# Altium schematic sheet OpenApolloV2_Altium_export_non-native.schdoc
size 843 x 614 mm
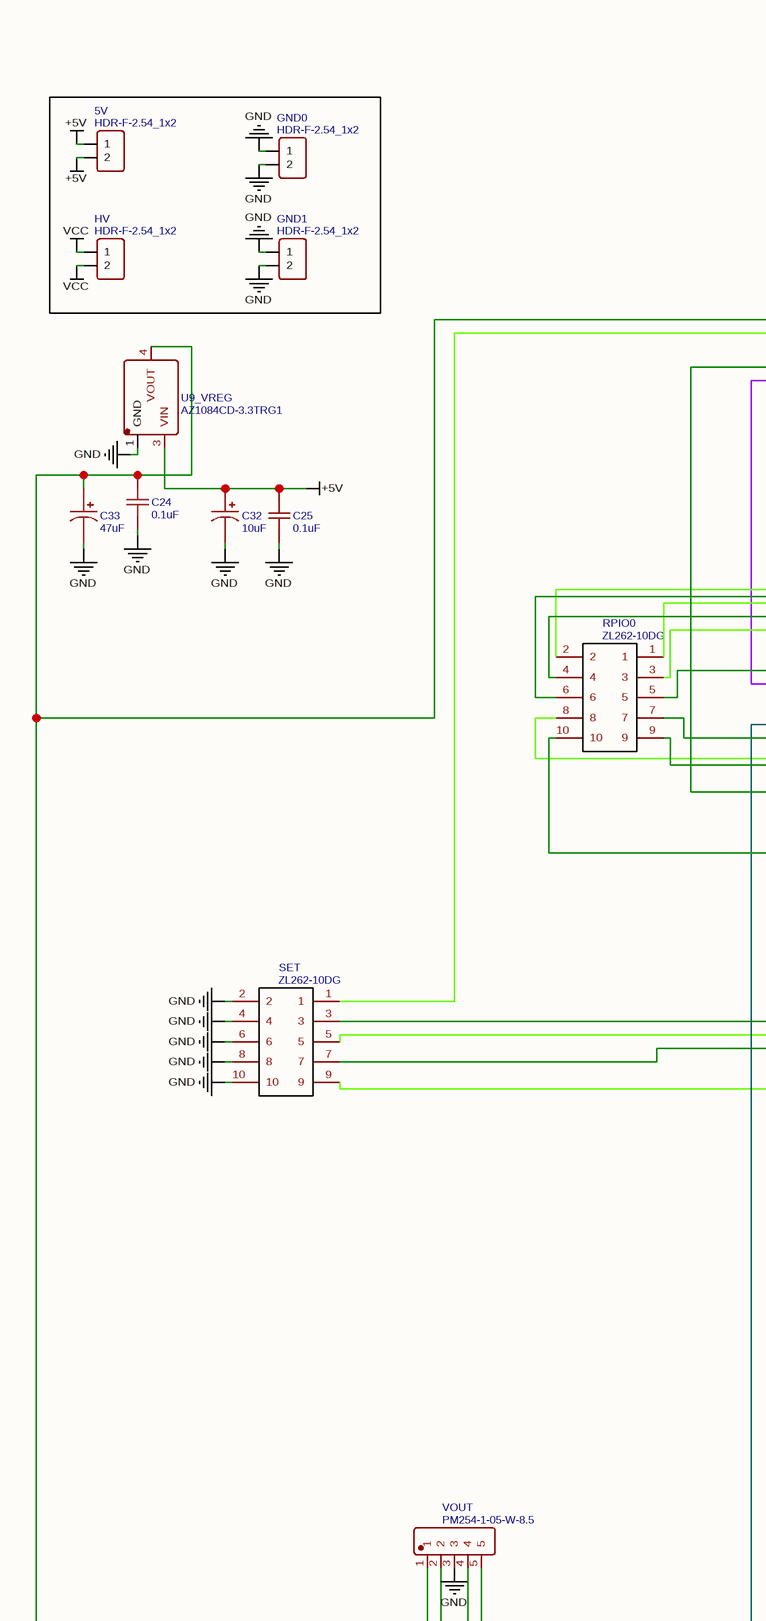
[diagram p0: OpenApolloV2_Altium_export_non-native.schdoc, top left]
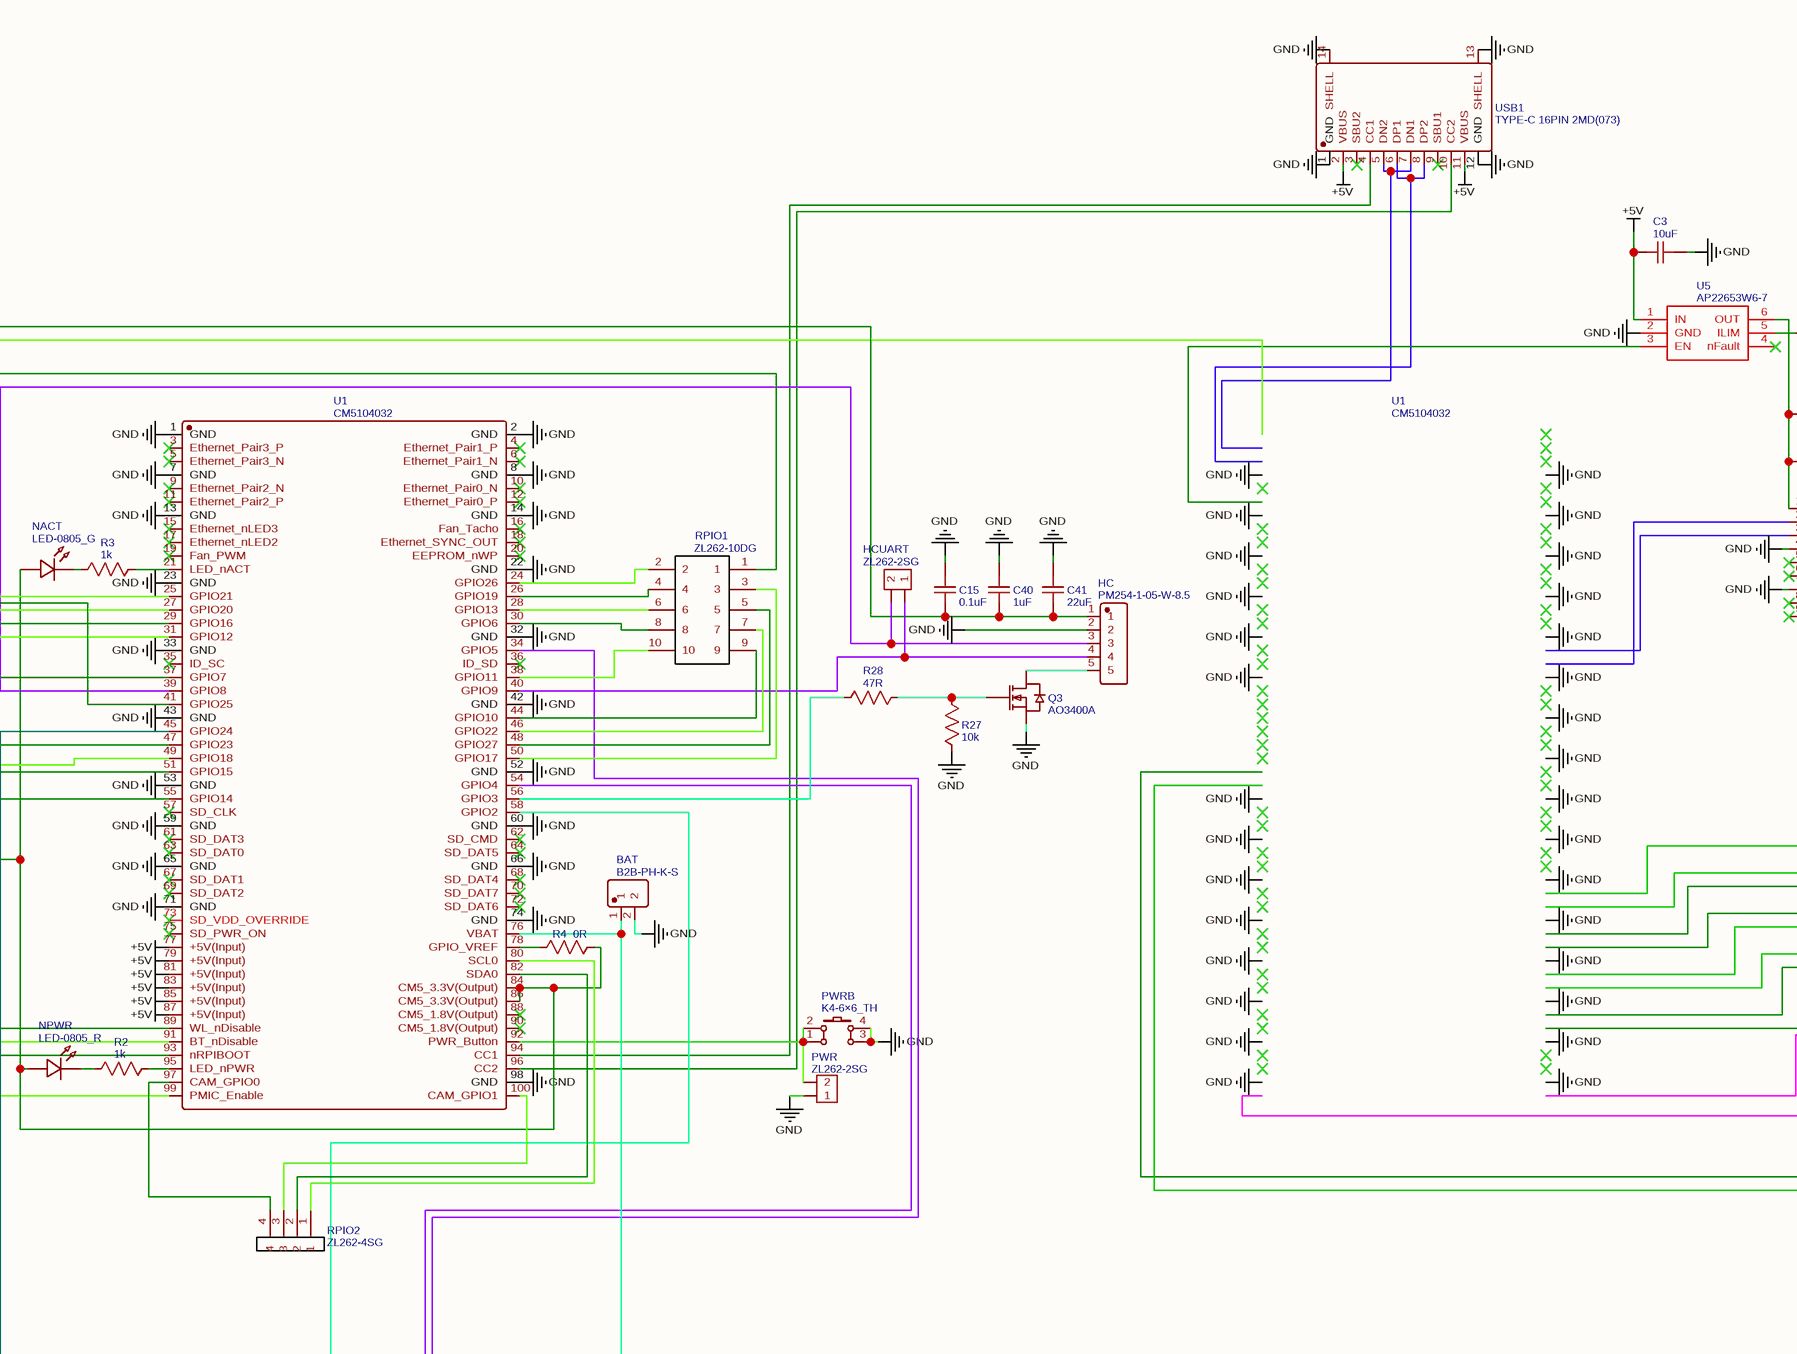
[diagram p1: OpenApolloV2_Altium_export_non-native.schdoc, top middle]
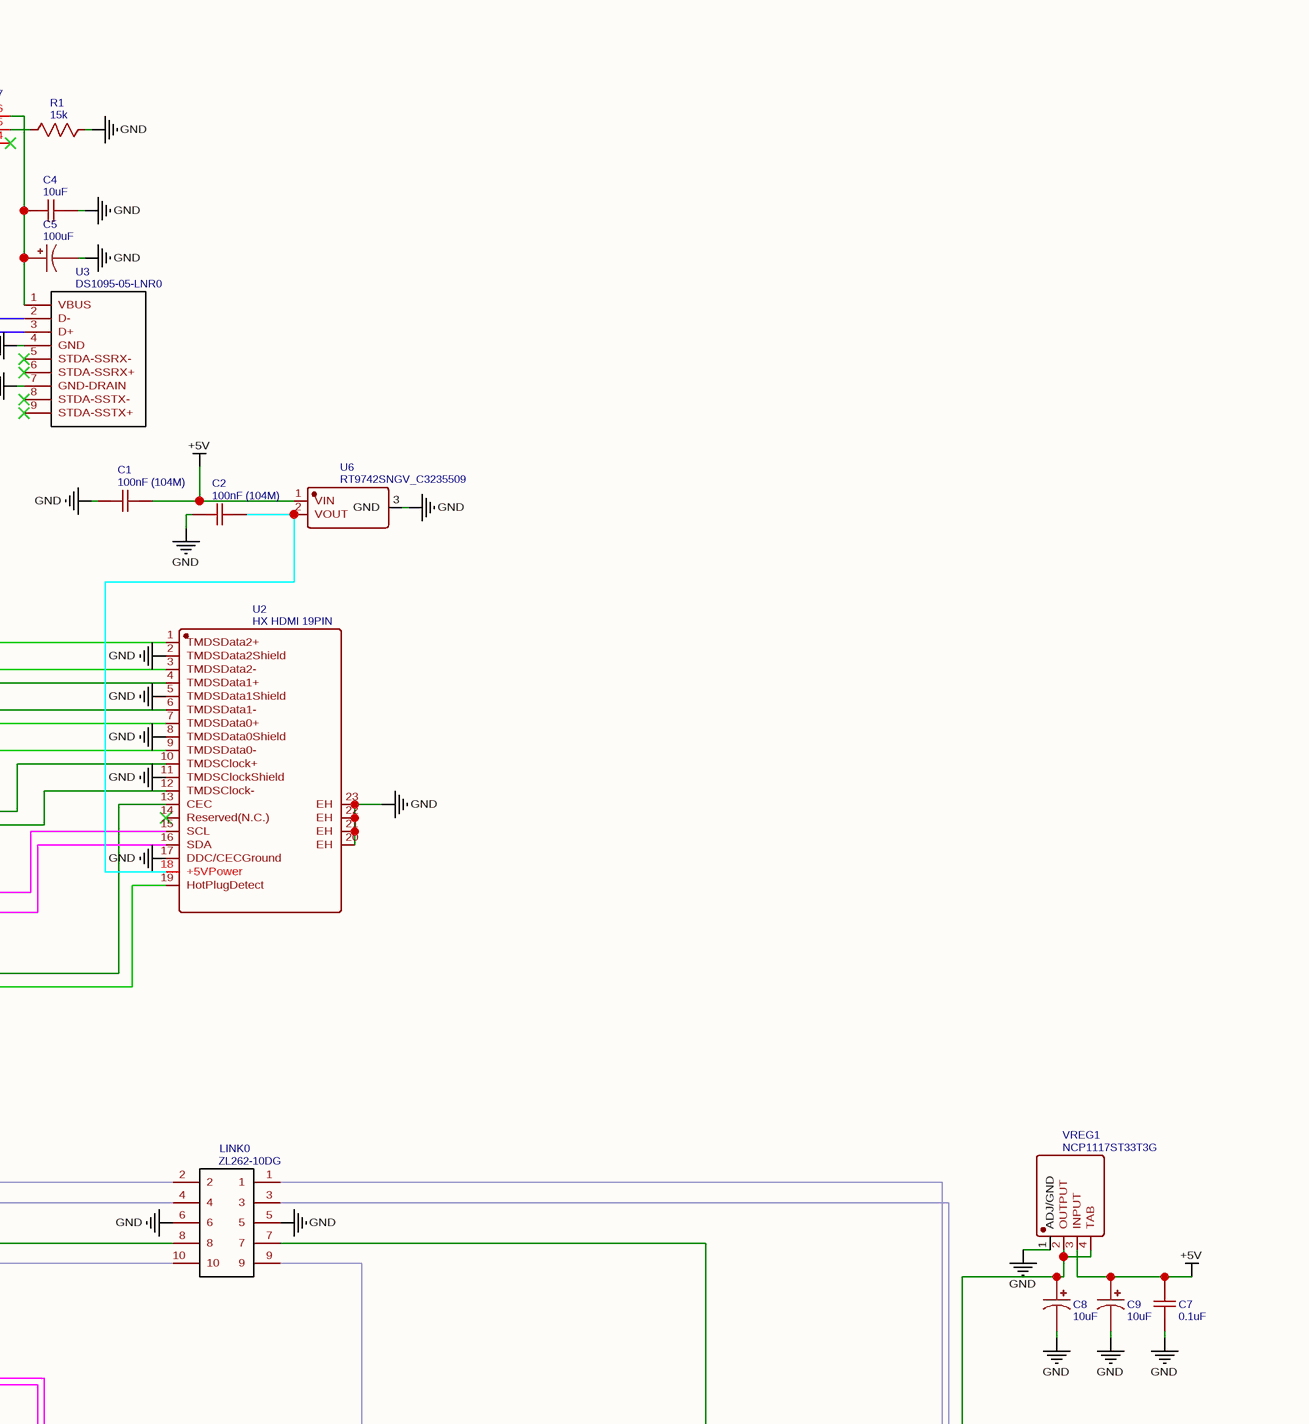
[diagram p2: OpenApolloV2_Altium_export_non-native.schdoc, top right]
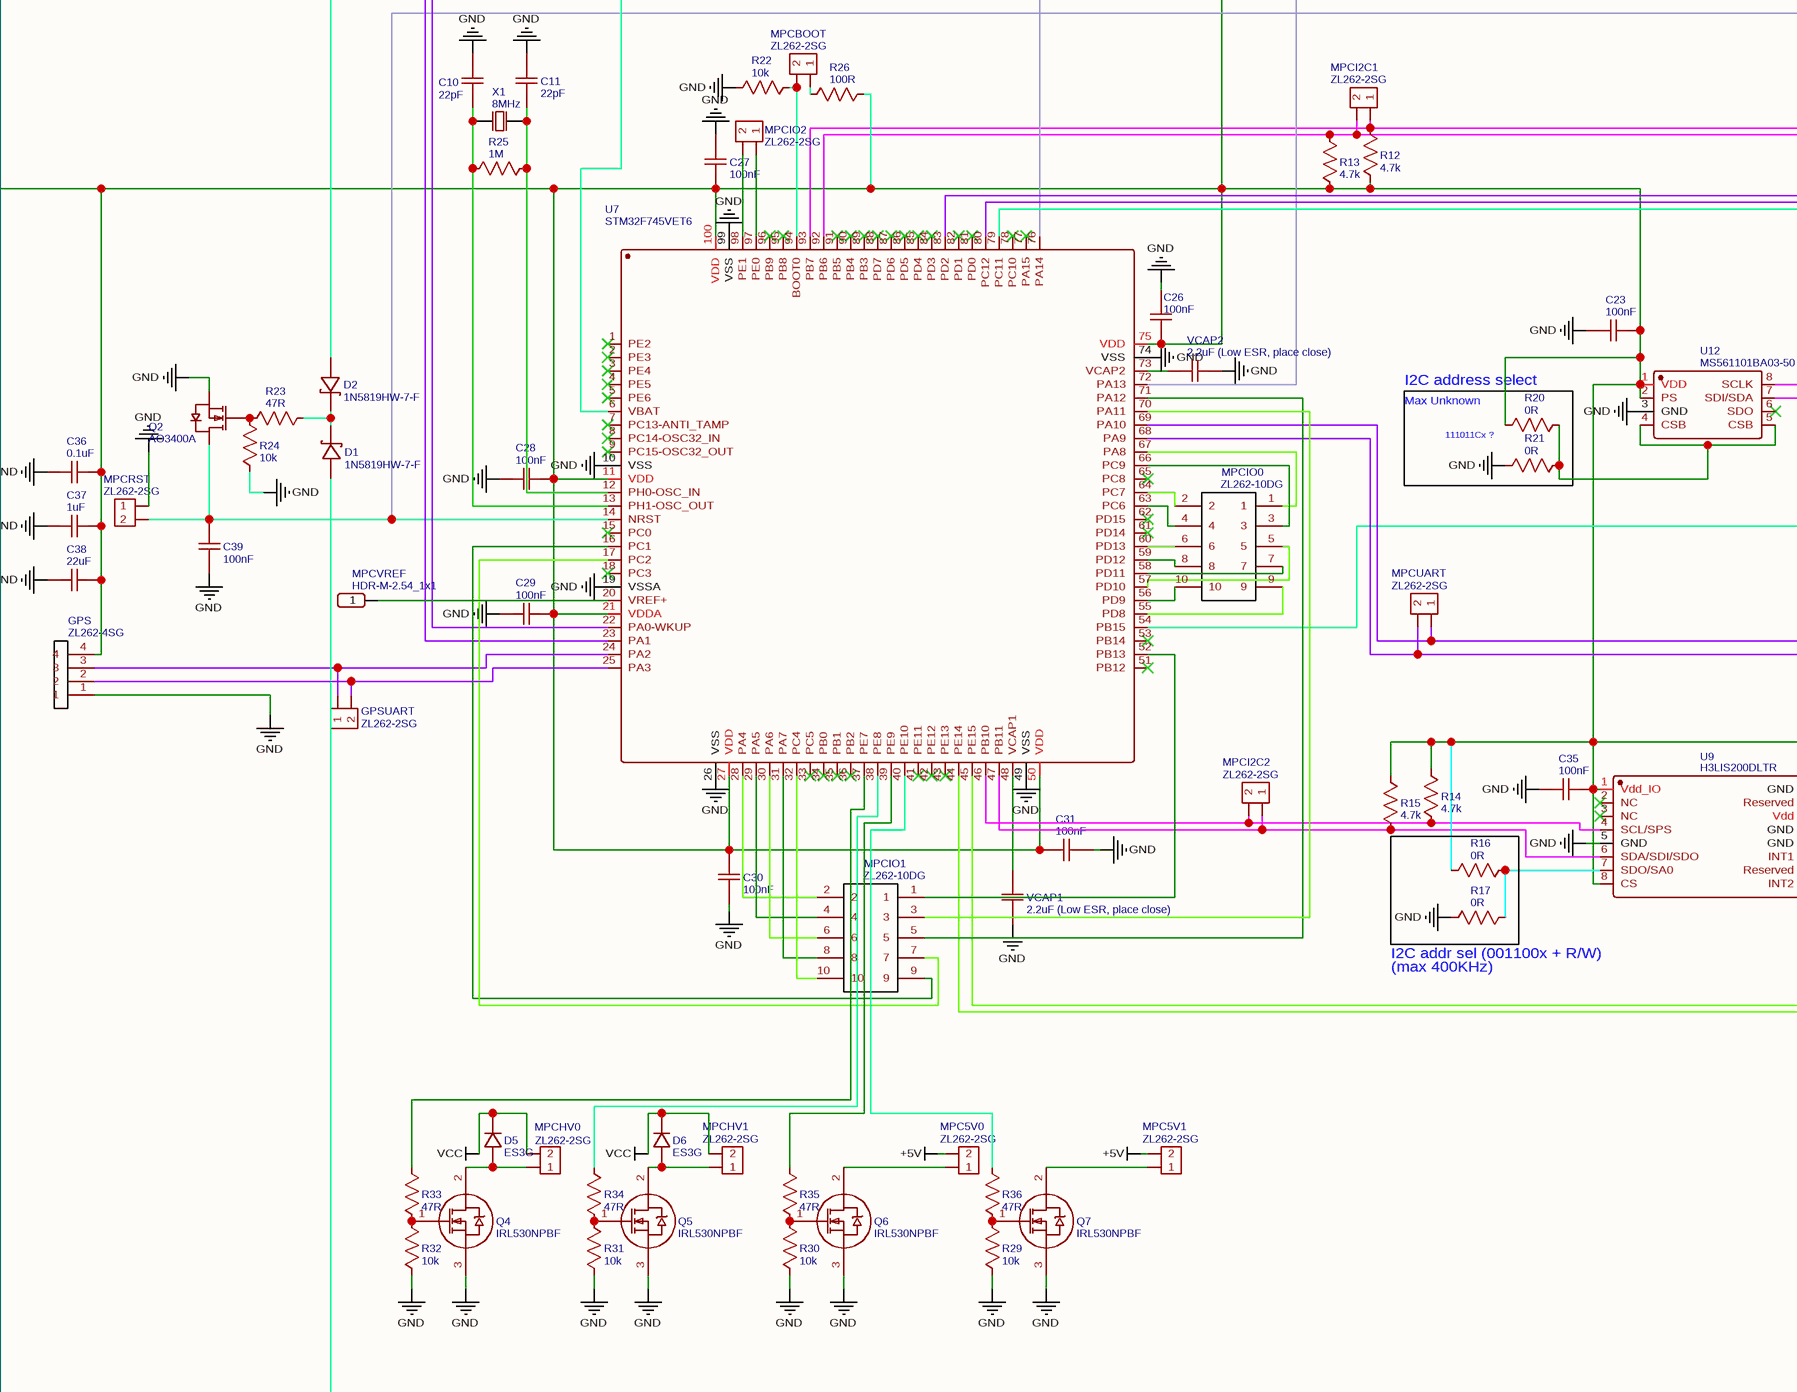
[diagram p3: OpenApolloV2_Altium_export_non-native.schdoc, bottom middle]
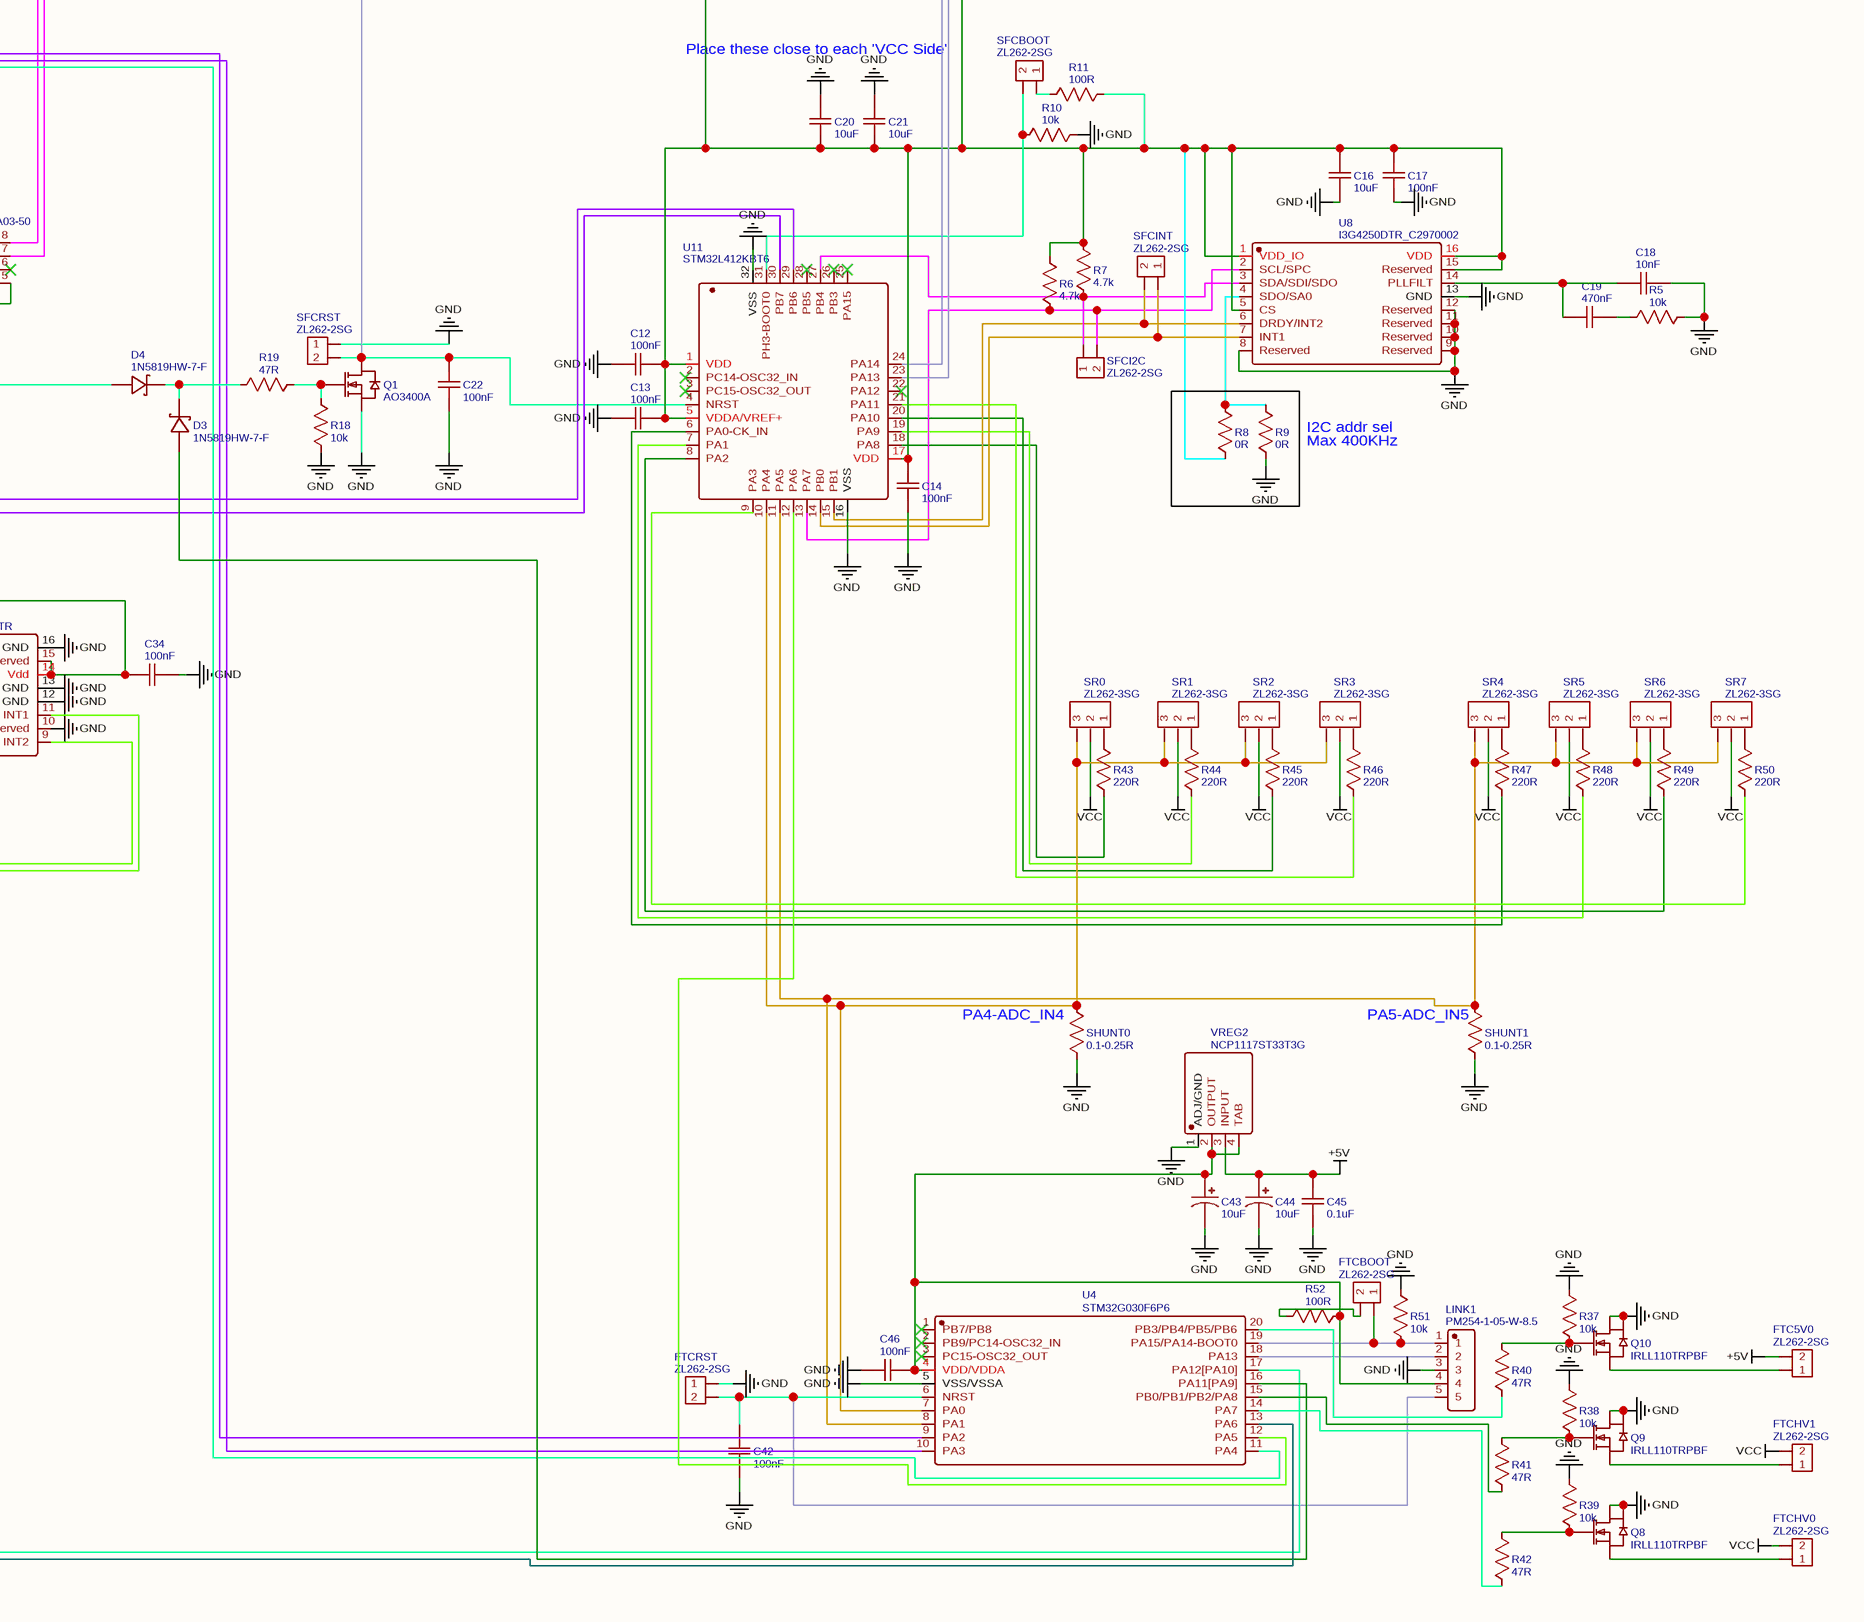
[diagram p4: OpenApolloV2_Altium_export_non-native.schdoc, bottom right]

## Parts
(Parts that share a designator on the sheet are numbered #1, #2 ... from top to bottom, then left to right.)
5V  HDR-F-2.54_1x2  [HDR-F-2.54_1X2]
BAT  B2B-PH-K-S  [CONN-TH_B2B-PH-K-S]
C1  100nF (104M)  [C0805]
C2  100nF (104M)  [C0805]
C3  10uF  [C0805]
C4  10uF  [C0805]
C5  100uF  [CAP-D5.0×F2.0]
C7  0.1uF  [C0805]
C8  10uF  [CAP-D5.0×F2.0]
C9  10uF  [CAP-D5.0×F2.0]
C10  22pF  [RAD-0.1]
C11  22pF  [RAD-0.1]
C12  100nF  [C0805]
C13  100nF  [C0805]
C14  100nF  [C0805]
C15  0.1uF  [C0805]
C16  10uF  [C0805]
C17  100nF  [C0805]
C18  10nF  [C0805]
C19  470nF  [C0805]
C20  10uF  [C0805]
C21  10uF  [C0805]
C22  100nF  [C0805]
C23  100nF  [C1206]
C24  0.1uF  [C0805]
C25  0.1uF  [C0805]
C26  100nF  [C0805]
C27  100nF  [C0805]
C28  100nF  [C0805]
C29  100nF  [C0805]
C30  100nF  [C0805]
C31  100nF  [C0805]
C32  10uF  [CAP-D5.0×F2.0]
C33  47uF  [CAP-D4.0×F1.5]
C34  100nF  [C0805]
C35  100nF  [C0805]
C36  0.1uF  [C0805]
C37  1uF  [C0805]
C38  22uF  [C0805]
C39  100nF  [C0805]
C40  1uF  [C0805]
C41  22uF  [C0805]
C42  100nF  [C0805]
C43  10uF  [CAP-D5.0×F2.0]
C44  10uF  [CAP-D5.0×F2.0]
C45  0.1uF  [C0805]
C46  100nF  [C0805]
D1  1N5819HW-7-F  [SOD-123_L2.7-W1.6-LS3.7-RD]
D2  1N5819HW-7-F  [SOD-123_L2.7-W1.6-LS3.7-RD]
D3  1N5819HW-7-F  [SOD-123_L2.7-W1.6-LS3.7-RD]
D4  1N5819HW-7-F  [SOD-123_L2.7-W1.6-LS3.7-RD]
D5  ES3G  [SMC_L7.1-W6.2-LS8.1-RD]
D6  ES3G  [SMC_L7.1-W6.2-LS8.1-RD]
FTC5V0  ZL262-2SG  [HEADER 1X2 FEMALE AG4]
FTCBOOT  ZL262-2SG  [HEADER 1X2 FEMALE AG4]
FTCHV0  ZL262-2SG  [HEADER 1X2 FEMALE AG4]
FTCHV1  ZL262-2SG  [HEADER 1X2 FEMALE AG4]
FTCRST  ZL262-2SG  [HEADER 1X2 FEMALE AG4]
GND0  HDR-F-2.54_1x2  [HDR-F-2.54_1X2]
GND1  HDR-F-2.54_1x2  [HDR-F-2.54_1X2]
GPS  ZL262-4SG  [TUSKESOR_ALJZET_4_LABU_ZL262-4SG]
GPSUART  ZL262-2SG  [HEADER 1X2 FEMALE AG4]
HC  PM254-1-05-W-8.5  [HDR-TH_5P-P2.54-H-F-W10.0-N]
HCUART  ZL262-2SG  [HEADER 1X2 FEMALE AG4]
HV  HDR-F-2.54_1x2  [HDR-F-2.54_1X2]
LINK0  ZL262-10DG  [ZL262-10DG]
LINK1  PM254-1-05-W-8.5  [HDR-TH_5P-P2.54-H-F-W10.0-N]
MPC5V0  ZL262-2SG  [HEADER 1X2 FEMALE AG4]
MPC5V1  ZL262-2SG  [HEADER 1X2 FEMALE AG4]
MPCBOOT  ZL262-2SG  [HEADER 1X2 FEMALE AG4]
MPCHV0  ZL262-2SG  [HEADER 1X2 FEMALE AG4]
MPCHV1  ZL262-2SG  [HEADER 1X2 FEMALE AG4]
MPCI2C1  ZL262-2SG  [HEADER 1X2 FEMALE AG4]
MPCI2C2  ZL262-2SG  [HEADER 1X2 FEMALE AG4]
MPCIO0  ZL262-10DG  [ZL262-10DG]
MPCIO1  ZL262-10DG  [ZL262-10DG]
MPCIO2  ZL262-2SG  [HEADER 1X2 FEMALE AG4]
MPCRST  ZL262-2SG  [HEADER 1X2 FEMALE AG4]
MPCUART  ZL262-2SG  [HEADER 1X2 FEMALE AG4]
MPCVREF  HDR-M-2.54_1x1  [HDR-M-2.54_1X1]
NACT  LED-0805_G  [LED0805_GREEN]
NPWR  LED-0805_R  [LED0805_RED]
PWR  ZL262-2SG  [HEADER 1X2 FEMALE AG4]
PWRB  K4-6×6_TH  [KEY-TH_4P-L6.0-W6.0-P4.50-LS6.5]
Q1  AO3400A  [SOT-23-3_L2.9-W1.3-P1.90-LS2.4-BR]
Q2  AO3400A  [SOT-23-3_L2.9-W1.3-P1.90-LS2.4-BR]
Q3  AO3400A  [SOT-23-3_L2.9-W1.3-P1.90-LS2.4-BR]
Q4  IRL530NPBF  [TO-220-3_L10.0-W4.5-P2.54-L]
Q5  IRL530NPBF  [TO-220-3_L10.0-W4.5-P2.54-L]
Q6  IRL530NPBF  [TO-220-3_L10.0-W4.5-P2.54-L]
Q7  IRL530NPBF  [TO-220-3_L10.0-W4.5-P2.54-L]
Q8  IRLL110TRPBF  [SOT-223_L6.5-W3.5-P2.30-LS7.0-BR]
Q9  IRLL110TRPBF  [SOT-223_L6.5-W3.5-P2.30-LS7.0-BR]
Q10  IRLL110TRPBF  [SOT-223_L6.5-W3.5-P2.30-LS7.0-BR]
R1  15k  [R0805]
R2  1k  [R0805]
R3  1k  [R0805]
R4  0R  [R0805]
R5  10k  [R0805]
R6  4.7k  [R0805]
R7  4.7k  [R0805]
R8  0R  [R0805]
R9  0R  [R0805]
R10  10k  [R0805]
R11  100R  [R0805]
R12  4.7k  [R0805]
R13  4.7k  [R0805]
R14  4.7k  [R0805]
R15  4.7k  [R0805]
R16  0R  [R0805]
R17  0R  [R0805]
R18  10k  [R0805]
R19  47R  [R0805]
R20  0R  [R0805]
R21  0R  [R0805]
R22  10k  [R0805]
R23  47R  [R0805]
R24  10k  [R0805]
R25  1M  [R0805]
R26  100R  [R0805]
R27  10k  [R0805]
R28  47R  [R0805]
R29  10k  [R0805]
R30  10k  [R0805]
R31  10k  [R0805]
R32  10k  [R0805]
R33  47R  [R0805]
R34  47R  [R0805]
R35  47R  [R0805]
R36  47R  [R0805]
R37  10k  [R0805]
R38  10k  [R0805]
R39  10k  [R0805]
R40  47R  [R0805]
R41  47R  [R0805]
R42  47R  [R0805]
R43  220R  [R0805]
R44  220R  [R0805]
R45  220R  [R0805]
R46  220R  [R0805]
R47  220R  [R0805]
R48  220R  [R0805]
R49  220R  [R0805]
R50  220R  [R0805]
R51  10k  [R0805]
R52  100R  [R0805]
RPIO0  ZL262-10DG  [ZL262-10DG]
RPIO1  ZL262-10DG  [ZL262-10DG]
RPIO2  ZL262-4SG  [TUSKESOR_ALJZET_4_LABU_ZL262-4SG]
SET  ZL262-10DG  [ZL262-10DG]
SFCBOOT  ZL262-2SG  [HEADER 1X2 FEMALE AG4]
SFCI2C  ZL262-2SG  [HEADER 1X2 FEMALE AG4]
SFCINT  ZL262-2SG  [HEADER 1X2 FEMALE AG4]
SFCRST  ZL262-2SG  [HEADER 1X2 FEMALE AG4]
SHUNT0  0.1-0.25R  [R_AXIAL-1.0]
SHUNT1  0.1-0.25R  [R_AXIAL-1.0]
SR0  ZL262-3SG  [HDR-F-2.54_1X3]
SR1  ZL262-3SG  [HDR-F-2.54_1X3]
SR2  ZL262-3SG  [HDR-F-2.54_1X3]
SR3  ZL262-3SG  [HDR-F-2.54_1X3]
SR4  ZL262-3SG  [HDR-F-2.54_1X3]
SR5  ZL262-3SG  [HDR-F-2.54_1X3]
SR6  ZL262-3SG  [HDR-F-2.54_1X3]
SR7  ZL262-3SG  [HDR-F-2.54_1X3]
U1#1  CM5104032  [COMM-SMD_L55.0-W40.0_CM5]
U1#2  CM5104032  [COMM-SMD_L55.0-W40.0_CM5]
U2  HX HDMI 19PIN  [HDMI-SMD_HX-HDMI-19PIN]
U3  DS1095-05-LNR0  [DS1095-05-LNR0]
U4  STM32G030F6P6  [TSSOP-20_L6.5-W4.4-P0.65-LS6.4-BL]
U5  AP22653W6-7  [AP22653W6-7]
U6  RT9742SNGV_C3235509  [SOT-23-3_L2.9-W1.6-P1.90-LS2.8-BR]
U7  STM32F745VET6  [LQFP-100_L14.0-W14.0-P0.50-LS16.0-BL]
U8  I3G4250DTR_C2970002  [LGA-16_L4.0-W4.0-P0.65-TL]
U9  H3LIS200DLTR  [LGA-16_L3.0-W3.0-P0.50-BL]
U9_VREG  AZ1084CD-3.3TRG1  [TO-252-2_L6.5-W6.1-P4.58-LS10.0-TL]
U11  STM32L412KBT6  [LQFP-32_L7.0-W7.0-P0.80-LS9.0-BL]
U12  MS561101BA03-50  [SENSORS-SMD_MS5611-01BA03]
USB1  TYPE-C 16PIN 2MD(073)  [USB-C-SMD_TYPE-C-6PIN-2MD-073]
VCAP1  2.2uF (Low ESR, place close)  [C0805]
VCAP2  2.2uF (Low ESR, place close)  [C0805]
VOUT  PM254-1-05-W-8.5  [HDR-TH_5P-P2.54-H-F-W10.0-N]
VREG1  NCP1117ST33T3G  [SOT-223-3_L6.5-W3.4-P2.30-LS7.0-BR]
VREG2  NCP1117ST33T3G  [SOT-223-3_L6.5-W3.4-P2.30-LS7.0-BR]
X1  8MHz  [HC-49S_L11.5-W4.7-P4.88]

## Blocks framed on the sheet
I2C address select: R20 R21

## Nets
+5V: 5V.1 5V.2 C1.2 C3.1 C7.2 C9.1 C25.2 C32.1 C44.1 C45.2 FTC5V0.2 MPC5V0.2 MPC5V1.2 U1#1.77(+5V(Input)) U1#1.79(+5V(Input)) U1#1.81(+5V(Input)) U1#1.83(+5V(Input)) U1#1.85(+5V(Input)) U1#1.87(+5V(Input)) U5.1(IN) U6.1(VIN) U9_VREG.3(VIN) USB1.2(VBUS) USB1.11(VBUS) VREG1.3(INPUT) VREG2.3(INPUT)
GND: BAT.2 C1.1 C2.1 C3.2 C4.2 C5.2 C7.1 C8.2 C9.2 C10.1 C11.1 C12.1 C13.1 C14.1 C15.2 C16.1 C17.1 C18.2 C20.2 C21.2 C22.1 C23.1 C24.1 C25.1 C26.1 C27.1 C28.1 C29.1 C30.1 C31.1 C32.2 C33.2 C34.2 C35.1 C36.1 C37.1 C38.1 C39.1 C40.2 C41.2 C42.1 C43.2 C44.2 C45.1 C46.1 FTCRST.1 GND0.1 GND0.2 GND1.1 GND1.2 GPS.1 HC.2 LINK0.5 LINK0.6 LINK1.3 MPCRST.1 PWR.1 PWRB.3 PWRB.4 Q1.2(S) Q2.2(S) Q3.2(S) Q4.3(S) Q5.3(S) Q6.3(S) Q7.3(S) Q8.2(D) Q8.4(D) Q9.2(D) Q9.4(D) Q10.2(D) Q10.4(D) R1.2 R5.2 R9.1 R10.2 R17.1 R18.1 R21.1 R22.1 R24.1 R27.1 R29.1 R30.1 R31.1 R32.1 R37.2 R38.2 R39.2 R51.2 SET.2 SET.4 SET.6 SET.8 SET.10 SFCRST.1 SHUNT0.1 SHUNT1.1 U1#1.1(GND) U1#1.2(GND) U1#1.7(GND) U1#1.8(GND) U1#1.13(GND) U1#1.14(GND) U1#1.22(GND) U1#1.23(GND) U1#1.32(GND) U1#1.33(GND) U1#1.42(GND) U1#1.43(GND) U1#1.52(GND) U1#1.53(GND) U1#1.59(GND) U1#1.60(GND) U1#1.65(GND) U1#1.66(GND) U1#1.71(GND) U1#1.74(GND) U1#1.98(GND) U2.2(TMDSData2Shield) U2.5(TMDSData1Shield) U2.8(TMDSData0Shield) U2.11(TMDSClockShield) U2.17(DDC/CECGround) U2.20(EH) U2.21(EH) U2.22(EH) U2.23(EH) U3.4(GND) U3.7(GND-DRAIN) U4.5(VSS/VSSA) U5.2(GND) U6.3(GND) U7.10(VSS) U7.19(VSSA) U7.26(VSS) U7.49(VSS) U7.74(VSS) U7.99(VSS) U8.8(Reserved) U8.9(Reserved) U8.10(Reserved) U8.11(Reserved) U8.12(Reserved) U8.13(GND) U9.5(GND) U9.10(Reserved) U9.12(GND) U9.13(GND) U9.16(GND) U9_VREG.1(GND) U11.16(VSS) U11.32(VSS) U12.3(GND) USB1.1(GND) USB1.12(GND) USB1.13(SHELL) USB1.14(SHELL) VCAP1.1 VCAP2.2 VOUT.3 VREG1.1(ADJ/GND) VREG2.1(ADJ/GND)
VCC: D5.1 D6.1 FTCHV0.2 FTCHV1.2 HV.1 HV.2 MPCHV0.2 MPCHV1.2 SR0.2 SR1.2 SR2.2 SR3.2 SR4.2 SR5.2 SR6.2 SR7.2
NetBAT_1: BAT.1 U1#1.76(VBAT) U7.6(VBAT)
NetC2_2: C2.2 U2.18(+5VPower) U6.2(VOUT)
NetC4_1: C4.1 C5.1 U3.1(VBUS) U5.6(OUT)
NetC8_1: C8.1 C12.2 C13.2 C14.2 C16.2 C17.2 C20.1 C21.1 LINK0.7 R6.2 R7.2 R8.1 R11.2 U8.1(VDD_IO) U8.5(CS) U8.15(Reserved) U8.16(VDD) U11.1(VDD) U11.5(VDDA/VREF+) U11.17(VDD) VREG1.2(OUTPUT) VREG1.4(TAB)
NetC10_2: C10.2 R25.2 U7.13(PH1-OSC_OUT) X1.2
NetC11_2: C11.2 R25.1 U7.12(PH0-OSC_IN) X1.1
NetC15_1: C15.1 C23.2 C24.2 C26.2 C27.2 C28.2 C29.2 C30.2 C31.2 C33.1 C34.1 C35.2 C36.2 C37.2 C38.2 C40.1 C41.1 GPS.4 HC.1 LINK0.8 R12.1 R13.1 R14.2 R15.2 R16.1 R20.1 R26.1 U7.11(VDD) U7.21(VDDA) U7.27(VDD) U7.50(VDD) U7.75(VDD) U7.100(VDD) U9.1(Vdd_IO) U9.8(CS) U9.14(Vdd) U9.15(Reserved) U9_VREG.4(VOUT) U12.1(VDD) U12.2(PS) VOUT.1 VOUT.2 VOUT.4 VOUT.5
NetC18_1: C18.1 C19.1 U8.14(PLLFILT)
NetC19_2: C19.2 R5.1
NetC22_2: C22.2 LINK0.9 Q1.3(D) SFCRST.2 U11.4(NRST)
NetC39_2: C39.2 LINK0.10 MPCRST.2 Q2.3(D) U7.14(NRST)
NetC42_2: C42.2 FTCRST.2 LINK1.5 U4.6(NRST)
NetC43_1: C43.1 C46.2 LINK1.4 R52.2 U4.4(VDD/VDDA) VREG2.2(OUTPUT) VREG2.4(TAB)
NetD1_1: D1.1(K) D2.1(K) R23.1
NetD1_2: D1.2(A) U4.17(PA12[PA10])
NetD2_2: D2.2(A) U1#1.58(GPIO2)
NetD3_1: D3.1(K) D4.1(K) R19.1
NetD3_2: D3.2(A) U4.16(PA11[PA9])
NetD4_2: D4.2(A) U7.54(PB15)
NetD5_2: D5.2 MPCHV0.1 Q4.2(D)
NetD6_2: D6.2 MPCHV1.1 Q5.2(D)
NetFTC5V0_1: FTC5V0.1 Q10.3(S)
NetFTCBOOT_1: FTCBOOT.1 LINK1.1 R51.1 U4.19(PA15/PA14-BOOT0)
NetFTCBOOT_2: FTCBOOT.2 R52.1
NetFTCHV0_1: FTCHV0.1 Q8.3(S)
NetFTCHV1_1: FTCHV1.1 Q9.3(S)
NetGPS_2: GPS.2 GPSUART.2 U7.25(PA3)
NetGPS_3: GPS.3 GPSUART.1 U7.24(PA2)
NetHC_3: HC.3 HCUART.2 U1#1.39(GPIO8)
NetHC_4: HC.4 HCUART.1 U1#1.40(GPIO9)
NetHC_5: HC.5 Q3.3(D)
NetLINK0_1: LINK0.1 U11.24(PA14)
NetLINK0_2: LINK0.2 U7.76(PA14)
NetLINK0_3: LINK0.3 U11.23(PA13)
NetLINK0_4: LINK0.4 U7.72(PA13)
NetLINK1_2: LINK1.2 U4.18(PA13)
NetMPC5V0_1: MPC5V0.1 Q6.2(D)
NetMPC5V1_1: MPC5V1.1 Q7.2(D)
NetMPCBOOT_1: MPCBOOT.1 R26.2
NetMPCBOOT_2: MPCBOOT.2 R22.2 U7.94(BOOT0)
NetMPCI2C1_1: MPCI2C1.1 R12.2 U7.93(PB7) U12.7(SDI/SDA)
NetMPCI2C1_2: MPCI2C1.2 R13.2 U7.92(PB6) U12.8(SCLK)
NetMPCI2C2_1: MPCI2C2.1 R15.1 U7.47(PB11) U9.6(SDA/SDI/SDO)
NetMPCI2C2_2: MPCI2C2.2 R14.1 U7.46(PB10) U9.4(SCL/SPS)
NetMPCIO0_1: MPCIO0.1 U7.67(PA8)
NetMPCIO0_2: MPCIO0.2 U7.64(PC7)
NetMPCIO0_3: MPCIO0.3 U7.66(PC9)
NetMPCIO0_4: MPCIO0.4 U7.63(PC6)
NetMPCIO0_5: MPCIO0.5 U7.57(PD10)
NetMPCIO0_6: MPCIO0.6 U7.60(PD13)
NetMPCIO0_7: MPCIO0.7 U7.58(PD11)
NetMPCIO0_8: MPCIO0.8 U7.59(PD12)
NetMPCIO0_9: MPCIO0.9 U7.55(PD8)
NetMPCIO0_10: MPCIO0.10 U7.56(PD9)
NetMPCIO1_1: MPCIO1.1 U7.52(PB13)
NetMPCIO1_2: MPCIO1.2 U7.28(PA4)
NetMPCIO1_3: MPCIO1.3 U7.70(PA11)
NetMPCIO1_4: MPCIO1.4 U7.29(PA5)
NetMPCIO1_5: MPCIO1.5 U7.71(PA12)
NetMPCIO1_6: MPCIO1.6 U7.30(PA6)
NetMPCIO1_7: MPCIO1.7 U7.17(PC2)
NetMPCIO1_8: MPCIO1.8 U7.31(PA7)
NetMPCIO1_9: MPCIO1.9 U7.16(PC1)
NetMPCIO1_10: MPCIO1.10 U7.32(PC4)
NetMPCIO2_1: MPCIO2.1 U7.97(PE0)
NetMPCIO2_2: MPCIO2.2 U7.98(PE1)
NetMPCUART_1: MPCUART.1 U7.69(PA10) U11.29(PB6)
NetMPCUART_2: MPCUART.2 U7.68(PA9) U11.30(PB7)
NetMPCVREF_1: MPCVREF.1 U7.20(VREF+)
NetNACT_1: NACT.1 NPWR.1 R4.2 RPIO0.10 U1#1.84(CM5_3.3V(Output)) U1#1.86(CM5_3.3V(Output))
NetNACT_2: NACT.2 R3.1
NetNPWR_2: NPWR.2 R2.1
NetPWR_2: PWR.2 PWRB.1 PWRB.2 U1#1.92(PWR_Button)
NetQ1_1: Q1.1(G) R18.2 R19.2
NetQ2_1: Q2.1(G) R23.2 R24.2
NetQ3_1: Q3.1(G) R27.2 R28.1
NetQ4_1: Q4.1(G) R32.2 R33.1
NetQ5_1: Q5.1(G) R31.2 R34.1
NetQ6_1: Q6.1(G) R30.2 R35.1
NetQ7_1: Q7.1(G) R29.2 R36.1
NetQ8_1: Q8.1(G) R39.1 R42.2
NetQ9_1: Q9.1(G) R38.1 R41.2
NetQ10_1: Q10.1(G) R37.1 R40.2
NetR1_1: R1.1 U5.5(ILIM)
NetR2_2: R2.2 U1#1.95(LED_nPWR)
NetR3_2: R3.2 U1#1.21(LED_nACT)
NetR4_1: R4.1 U1#1.78(GPIO_VREF)
NetR6_1: R6.1 SFCI2C.2 U8.2(SCL/SPC) U11.13(PA7)
NetR7_1: R7.1 SFCI2C.1 U8.3(SDA/SDI/SDO) U11.27(PB4)
NetR8_2: R8.2 R9.2 U8.4(SDO/SA0)
NetR10_1: R10.1 SFCBOOT.2 U11.31(PH3-BOOT0)
NetR11_1: R11.1 SFCBOOT.1
NetR16_2: R16.2 R17.2 U9.7(SDO/SA0)
NetR20_2: R20.2 R21.2 U12.4(CSB) U12.5(CSB)
NetR28_2: R28.2 U1#1.56(GPIO3)
NetR33_2: R33.2 U7.37(PE7)
NetR34_2: R34.2 U7.38(PE8)
NetR35_2: R35.2 U7.39(PE9)
NetR36_2: R36.2 U7.40(PE10)
NetR40_1: R40.1 U4.20(PB3/PB4/PB5/PB6)
NetR41_1: R41.1 U4.15(PB0/PB1/PB2/PA8)
NetR42_1: R42.1 U4.14(PA7)
NetR43_1: R43.1 U11.18(PA8)
NetR43_2: R43.2 SR0.1
NetR44_1: R44.1 U11.19(PA9)
NetR44_2: R44.2 SR1.1
NetR45_1: R45.1 U11.20(PA10)
NetR45_2: R45.2 SR2.1
NetR46_1: R46.1 U11.21(PA11)
NetR46_2: R46.2 SR3.1
NetR47_1: R47.1 U11.6(PA0-CK_IN)
NetR47_2: R47.2 SR4.1
NetR48_1: R48.1 U11.7(PA1)
NetR48_2: R48.2 SR5.1
NetR49_1: R49.1 U11.8(PA2)
NetR49_2: R49.2 SR6.1
NetR50_1: R50.1 U11.9(PA3)
NetR50_2: R50.2 SR7.1
NetRPIO0_1: RPIO0.1 U1#1.27(GPIO20)
NetRPIO0_2: RPIO0.2 U1#1.25(GPIO21)
NetRPIO0_3: RPIO0.3 U1#1.31(GPIO12)
NetRPIO0_4: RPIO0.4 U1#1.29(GPIO16)
NetRPIO0_5: RPIO0.5 U1#1.37(GPIO7)
NetRPIO0_6: RPIO0.6 U1#1.41(GPIO25)
NetRPIO0_7: RPIO0.7 U1#1.47(GPIO23)
NetRPIO0_8: RPIO0.8 U1#1.49(GPIO18)
NetRPIO0_9: RPIO0.9 U1#1.51(GPIO15)
NetRPIO1_1: RPIO1.1 U1#1.55(GPIO14)
NetRPIO1_2: RPIO1.2 U1#1.24(GPIO26)
NetRPIO1_3: RPIO1.3 U1#1.50(GPIO17)
NetRPIO1_4: RPIO1.4 U1#1.26(GPIO19)
NetRPIO1_5: RPIO1.5 U1#1.48(GPIO27)
NetRPIO1_6: RPIO1.6 U1#1.28(GPIO13)
NetRPIO1_7: RPIO1.7 U1#1.46(GPIO22)
NetRPIO1_8: RPIO1.8 U1#1.30(GPIO6)
NetRPIO1_9: RPIO1.9 U1#1.44(GPIO10)
NetRPIO1_10: RPIO1.10 U1#1.38(GPIO11)
NetRPIO2_1: RPIO2.1 U1#1.80(SCL0)
NetRPIO2_2: RPIO2.2 U1#1.82(SDA0)
NetRPIO2_3: RPIO2.3 U1#1.100(CAM_GPIO1)
NetRPIO2_4: RPIO2.4 U1#1.97(CAM_GPIO0)
NetSET_3: SET.3 U1#1.89(WL_nDisable)
NetSET_5: SET.5 U1#1.91(BT_nDisable)
NetSET_7: SET.7 U1#1.93(nRPIBOOT)
NetSET_9: SET.9 U1#1.99(PMIC_Enable)
NetSFCINT_1: SFCINT.1 U8.7(INT1) U11.14(PB0)
NetSFCINT_2: SFCINT.2 U8.6(DRDY/INT2) U11.15(PB1)
NetSHUNT0_2: SHUNT0.2 SR0.3 SR1.3 SR2.3 SR3.3 U4.7(PA0) U11.10(PA4)
NetSHUNT1_2: SHUNT1.2 SR4.3 SR5.3 SR6.3 SR7.3 U4.8(PA1) U11.11(PA5)
NetU1#1_34: U1#1.34(GPIO5) U7.22(PA0-WKUP)
NetU1#1_45: U1#1.45(GPIO24) U4.13(PA6)
NetU1#1_54: U1#1.54(GPIO4) U7.23(PA1)
NetU1#1_94: U1#1.94(CC1) USB1.4(CC1)
NetU1#1_96: U1#1.96(CC2) USB1.10(CC2)
NetU4_9: U4.9(PA2) U7.83(PD2)
NetU4_10: U4.10(PA3) U7.80(PC12)
NetU4_11: U4.11(PA4) U7.79(PC11)
NetU4_12: U4.12(PA5) U11.12(PA6)
NetU7_44: U7.44(PE14) U9.11(INT1)
NetU7_45: U7.45(PE15) U9.9(INT2)
NetU7_48: U7.48(VCAP1) VCAP1.2
NetU7_73: U7.73(VCAP2) VCAP2.1
NetUSB1_5: USB1.5(DN2) USB1.7(DN1)
NetUSB1_6: USB1.6(DP1) USB1.8(DP2)

Not connected (* = marked no-connect by the designer): SET 1; U1#1 3(Ethernet_Pair3_P)* 4(Ethernet_Pair1_P)* 5(Ethernet_Pair3_N)* 6(Ethernet_Pair1_N)* 9(Ethernet_Pair2_N)* 10(Ethernet_Pair0_N)* 11(Ethernet_Pair2_P)* 12(Ethernet_Pair0_P)* 15(Ethernet_nLED3)* 16(Fan_Tacho)* 17(Ethernet_nLED2)* 18(Ethernet_SYNC_OUT)* 19(Fan_PWM)* 20(EEPROM_nWP)* 35(ID_SC)* 36(ID_SD)* 57(SD_CLK)* 61(SD_DAT3)* 62(SD_CMD)* 63(SD_DAT0)* 64(SD_DAT5)* 67(SD_DAT1)* 68(SD_DAT4)* 69(SD_DAT2)* 70(SD_DAT7)* 72(SD_DAT6)* 73(SD_VDD_OVERRIDE)* 75(SD_PWR_ON)* 88(CM5_1.8V(Output))* 90(CM5_1.8V(Output))*; U2 1(TMDSData2+) 3(TMDSData2-) 4(TMDSData1+) 6(TMDSData1-) 7(TMDSData0+) 9(TMDSData0-) 10(TMDSClock+) 12(TMDSClock-) 13(CEC) 14(Reserved(N.C.))* 15(SCL) 16(SDA) 19(HotPlugDetect); U3 2(D-) 3(D+) 5(STDA-SSRX-)* 6(STDA-SSRX+)* 8(STDA-SSTX-)* 9(STDA-SSTX+)*; U4 1(PB7/PB8)* 2(PB9/PC14-OSC32_IN)* 3(PC15-OSC32_OUT)*; U5 3(EN) 4(nFault)*; U7 1(PE2)* 2(PE3)* 3(PE4)* 4(PE5)* 5(PE6)* 7(PC13-ANTI_TAMP)* 8(PC14-OSC32_IN)* 9(PC15-OSC32_OUT)* 15(PC0)* 18(PC3)* 33(PC5)* 34(PB0)* 35(PB1)* 36(PB2)* 41(PE11)* 42(PE12)* 43(PE13)* 51(PB12)* 53(PB14)* 61(PD14)* 62(PD15)* 65(PC8)* 77(PA15)* 78(PC10)* 81(PD0)* 82(PD1)* 84(PD3)* 85(PD4)* 86(PD5)* 87(PD6)* 88(PD7)* 89(PB3)* 90(PB4)* 91(PB5)* 95(PB8)* 96(PB9)*; U9 2(NC)* 3(NC)*; U11 2(PC14-OSC32_IN)* 3(PC15-OSC32_OUT)* 22(PA12)* 25(PA15)* 26(PB3)* 28(PB5)*; U12 6(SDO)*; USB1 3(SBU2)* 9(SBU1)*

## Notes on the sheet
- Place these close to each 'VCC Side'
- Max Unknown
- 111011Cx ?
- (near R9) Max 400KHz
- (near R9) I2C addr sel
- (near R17) I2C addr sel (001100x + R/W)
- (near R17) (max 400KHz)
- (near SHUNT0) PA4-ADC_IN4
- (near SHUNT1) PA5-ADC_IN5
- Labels drawn without touching a wire or pin: GND

## Library data of the parts
5V GND0 GND1 HV = HDR-F-2.54_1x2: Contributor: LCEDA_Lib; Supplier Part: C49661; Supplier: LCSC; spicePre: H; spiceSymbolName: HDR-F-2.54_1x2
BAT = B2B-PH-K-S: Manufacturer: JST; Contributor: lcsc; Supplier: LCSC; Supplier Part: C20504437; Manufacturer Part: B2B-PH-K-S; JLCPCB Part Class: Extended Part; spicePre: U; spiceSymbolName: B2B-PH-K-S
C1 C2 = 100nF (104M): nameAlias: Value(F); Contributor: LCEDA_Lib; spicePre: C; spiceSymbolName: C_0805_US
C3 C4 C8 C9 C16 C20 C21 C32 C43 C44 = 10uF: nameAlias: Value(F); Contributor: LCEDA_Lib; spicePre: C
  C3 C4 C16 C20 C21: spiceSymbolName: C_0805_US
  C8 C9 C32 C43 C44: spiceSymbolName: CE_TH_D5.0×F2.0_US
C5 = 100uF: nameAlias: Value(F); Contributor: LCEDA_Lib; spicePre: C; spiceSymbolName: CE_TH_D5.0×F2.0_US
C7 C15 C24 C25 C36 C45 = 0.1uF: nameAlias: Value(F); Contributor: LCEDA_Lib; spicePre: C; spiceSymbolName: C_0805_US
C10 C11 = 22pF: nameAlias: Value(F); Contributor: LCEDA_Lib; spicePre: C; spiceSymbolName: C_RAD-0.1_US
C12-C14 C17 C22 C23 C26-C31 C34 C35 C39 C42 C46 = 100nF: nameAlias: Value(F); Contributor: LCEDA_Lib; spicePre: C
  C12-C14 C17 C22 C26-C31 C34 C35 C39 C42 C46: spiceSymbolName: C_0805_US
  C23: spiceSymbolName: C_1206_US
C18 = 10nF: nameAlias: Value(F); Contributor: LCEDA_Lib; spicePre: C; spiceSymbolName: C_0805_US
C19 = 470nF: nameAlias: Value(F); Contributor: LCEDA_Lib; spicePre: C; spiceSymbolName: C_0805_US
C33 = 47uF: nameAlias: Value(F); Contributor: LCEDA_Lib; spicePre: C; spiceSymbolName: CE_TH_D4.0×F1.5_US
C37 C40 = 1uF: nameAlias: Value(F); Contributor: LCEDA_Lib; spicePre: C; spiceSymbolName: C_0805_US
C38 C41 = 22uF: nameAlias: Value(F); Contributor: LCEDA_Lib; spicePre: C; spiceSymbolName: C_0805_US
D1-D4 = 1N5819HW-7-F: Manufacturer: DIODES(美台); Supplier: LCSC; Manufacturer Part: 1N5819HW-7-F; Supplier Part: C82544; JLCPCB Part Class: Extended Part; spicePre: D; spiceSymbolName: 1N5819HW-7-F
D5 D6 = ES3G: Manufacturer: FMS(美丽微); Manufacturer Part: ES3G-C; Contributor: AVR_NEL; Supplier Part: C163764; Supplier: LCSC; JLCPCB Part Class: Extended Part; spicePre: D; spiceSymbolName: ES3G-C
FTC5V0 FTCBOOT FTCHV0 FTCHV1 FTCRST GPSUART HCUART MPC5V0 MPC5V1 MPCBOOT MPCHV0 MPCHV1 MPCI2C1 MPCI2C2 MPCIO2 MPCRST MPCUART PWR SFCBOOT SFCI2C SFCINT SFCRST = ZL262-2SG: Contributor: AndrzejGeciow; spicePre: S; spiceSymbolName: ZL262-2SG
GPS RPIO2 = ZL262-4SG: Contributor: eronald; spicePre: U; spiceSymbolName: Tuskesor_aljzet_4_labu_ZL262-4SG
HC LINK1 VOUT = PM254-1-05-W-8.5: Manufacturer: HCTL(华灿天禄); Contributor: LCSC; Supplier: LCSC; Supplier Part: C2897387; Manufacturer Part: PM254-1-05-W-8.5; JLCPCB Part Class: Extended Part; spicePre: U; spiceSymbolName: PM254-1-05-W-8.5
LINK0 MPCIO0 MPCIO1 RPIO0 RPIO1 SET = ZL262-10DG: Contributor: marton_m; spicePre: X; spiceSymbolName: ZL262-10DG
MPCVREF = HDR-M-2.54_1x1: Contributor: LCEDA_Lib; Supplier Part: C81276; Supplier: LCSC; spicePre: J; spiceSymbolName: HDR-M-2.54_1x1
NACT = LED-0805_G: Manufacturer: 国星光电; Manufacturer Part: NCD0805G1; Contributor: LCEDA_Lib; Supplier Part: C84260; spicePre: L; spiceSymbolName: LED-0805_G
NPWR = LED-0805_R: Manufacturer: EVERLIGHT(台湾亿光); Manufacturer Part: 17-21SURC/S530-A3/TR8; Contributor: LCEDA_Lib; Supplier Part: C72037; spicePre: L; spiceSymbolName: LED-0805_R
PWRB = K4-6×6_TH: Manufacturer: 韩国韩荣; Manufacturer Part: K2-1102DP-E4SW-04; Contributor: LCEDA_Lib; Supplier: LCSC; Supplier Part: C136684; spicePre: K; spiceSymbolName: K4-6×6_TH
Q1-Q3 = AO3400A: Manufacturer: AOS; Supplier: LCSC; Manufacturer Part: AO3400A; Supplier Part: C20917; JLCPCB Part Class: Basic Part; spicePre: Q; spiceSymbolName: AO3400A
Q4-Q7 = IRL530NPBF: Manufacturer: Infineon(英飞凌); Contributor: LCSC; Supplier: LCSC; Manufacturer Part: IRL530NPBF; Supplier Part: C85005; JLCPCB Part Class: Extended Part; spicePre: Q; spiceSymbolName: IRL530NPBF
Q8-Q10 = IRLL110TRPBF: Manufacturer: VISHAY(威世); Supplier: LCSC; Manufacturer Part: IRLL110TRPBF; Supplier Part: C128228; JLCPCB Part Class: Extended Part; spicePre: Q; spiceSymbolName: IRLL110TRPBF
R1 = 15k: nameAlias: Value(Ω); Contributor: LCEDA_Lib; spicePre: R; spiceSymbolName: R_0805_US
R2 R3 = 1k: nameAlias: Value(Ω); Contributor: LCEDA_Lib; spicePre: R; spiceSymbolName: R_0805_US
R4 R8 R9 R16 R17 R20 R21 = 0R: nameAlias: Value(Ω); Contributor: LCEDA_Lib; spicePre: R; spiceSymbolName: R_0805_US
R5 R10 R18 R22 R24 R27 R29-R32 R37-R39 R51 = 10k: nameAlias: Value(Ω); Contributor: LCEDA_Lib; spicePre: R; spiceSymbolName: R_0805_US
R6 R7 R12-R15 = 4.7k: nameAlias: Value(Ω); Contributor: LCEDA_Lib; spicePre: R; spiceSymbolName: R_0805_US
R11 R26 R52 = 100R: nameAlias: Value(Ω); Contributor: LCEDA_Lib; spicePre: R; spiceSymbolName: R_0805_US
R19 R23 R28 R33-R36 R40-R42 = 47R: nameAlias: Value(Ω); Contributor: LCEDA_Lib; spicePre: R; spiceSymbolName: R_0805_US
R25 = 1M: nameAlias: Value(Ω); Contributor: LCEDA_Lib; spicePre: R; spiceSymbolName: R_0805_US
R43-R50 = 220R: nameAlias: Value(Ω); Contributor: LCEDA_Lib; spicePre: R; spiceSymbolName: R_0805_US
SHUNT0 SHUNT1 = 0.1-0.25R: nameAlias: Value(Ω); Contributor: LCEDA_Lib; spicePre: R; spiceSymbolName: R_AXIAL-1.0_US
SR0-SR7 = ZL262-3SG: Manufacturer: CONNFLY; Contributor: AndrzejGeciow; Manufacturer Part: ZL262-3SG; Supplier Part: 00-00040667; Supplier: Kosmodrom; link: http://www.kosmodrom.com.ua/prodlist.php?page=0&name=00-00040667&okbutton=Search; spicePre: J; spiceSymbolName: ZL262-3SG
U1#1 U1#2 = CM5104032: Manufacturer: Raspberry Pi(树莓派); subpart_no: 1; Supplier: LCSC; Supplier Part: C42394220; Manufacturer Part: CM5104032; spicePre: U; spiceSymbolName: CM5104032
U2 = HX HDMI 19PIN: Manufacturer: hanxia(韩下); Contributor: lcsc; Supplier: LCSC; Supplier Part: C5184845; Manufacturer Part: HX HDMI 19PIN; JLCPCB Part Class: Extended Part; spicePre: U; spiceSymbolName: HX HDMI 19PIN
U3 = DS1095-05-LNR0: Manufacturer: Connfly electronic (Zhenqin); Manufacturer Part: DS1095-05LNR0; Contributor: zyk83zyk; spicePre: U; spiceSymbolName: DS1095-05-LNR0
U4 = STM32G030F6P6: Manufacturer: ST(意法半导体); Contributor: LCSC; Supplier: LCSC; Supplier Part: C724040; Manufacturer Part: STM32G030F6P6; JLCPCB Part Class: Extended Part; spicePre: U; spiceSymbolName: STM32G030F6P6
U5 = AP22653W6-7: Manufacturer: DIODES INC; Contributor: robertr2; Manufacturer Part: AP22653W6-7; Supplier Part: 31-AP22653W6-7TR-ND; Supplier: Digi-Key; link: https://www.diodes.com/assets/Datasheets/AP22652_53_52A_53A.pdf; spicePre: U; spiceSymbolName: AP22653W6-7
U6 = RT9742SNGV_C3235509: Manufacturer: RICHTEK(立锜); Contributor: lcsc; Supplier: LCSC; Supplier Part: C3235509; Manufacturer Part: RT9742SNGV; JLCPCB Part Class: Extended Part; spicePre: U; spiceSymbolName: RT9742SNGV_C3235509
U7 = STM32F745VET6: Manufacturer: ST(意法半导体); Supplier: LCSC; Manufacturer Part: STM32F745VET6; Supplier Part: C87700; JLCPCB Part Class: Extended Part; spicePre: U; spiceSymbolName: STM32F745VET6
U8 = I3G4250DTR_C2970002: Manufacturer: ST(意法半导体); Contributor: lcsc; Supplier: LCSC; Supplier Part: C2970002; Manufacturer Part: I3G4250DTR; JLCPCB Part Class: Extended Part; spicePre: U; spiceSymbolName: I3G4250DTR_C2970002
U9 = H3LIS200DLTR: Manufacturer: ST(意法半导体); Contributor: LCSC; Supplier: LCSC; Supplier Part: C2655078; Manufacturer Part: H3LIS200DLTR; JLCPCB Part Class: Extended Part; spicePre: U; spiceSymbolName: H3LIS200DLTR
U9_VREG = AZ1084CD-3.3TRG1: Manufacturer: DIODES(美台); Contributor: LCSC; Supplier: LCSC; Supplier Part: C151391; Manufacturer Part: AZ1084CD-3.3TRG1; JLCPCB Part Class: Extended Part; spicePre: U; spiceSymbolName: AZ1084CD-3.3TRG1
U11 = STM32L412KBT6: Manufacturer: ST(意法半导体); Contributor: LCSC; Supplier: LCSC; Supplier Part: C529438; Manufacturer Part: STM32L412KBT6; JLCPCB Part Class: Extended Part; spicePre: U; spiceSymbolName: STM32L412KBT6
U12 = MS561101BA03-50: Manufacturer: TE Connectivity(泰科电子); Contributor: LCSC; Supplier: LCSC; Supplier Part: C15639; Manufacturer Part: MS561101BA03-50; JLCPCB Part Class: Extended Part; spicePre: U; spiceSymbolName: MS561101BA03-50
USB1 = TYPE-C 16PIN 2MD(073): Manufacturer: SHOU HAN(首韩); Contributor: LCSC; Supplier: LCSC; Supplier Part: C2765186; Manufacturer Part: TYPE-C 16PIN 2MD(073); JLCPCB Part Class: Extended Part; spicePre: U; spiceSymbolName: TYPE-C 16PIN 2MD(073)
VCAP1 VCAP2 = 2.2uF (Low ESR, place close): nameAlias: Value(F); Contributor: LCEDA_Lib; spicePre: C; spiceSymbolName: C_0805_US
VREG1 VREG2 = NCP1117ST33T3G: Manufacturer: onsemi(安森美); timeStamp: 1466353290; Supplier: LCSC; Manufacturer Part: NCP1117ST33T3G; Supplier Part: C26537; JLCPCB Part Class: Extended Part; spicePre: U; spiceSymbolName: NCP1117ST33T3G
X1 = 8MHz: Manufacturer: LIMING(利明); Manufacturer Part: 49SS-25.00-8-10-10/B; nameAlias: Value; Contributor: lcsc; Supplier: LCSC; Supplier Part: C718637; JLCPCB Part Class: Extended Part; spicePre: X; spiceSymbolName: 49SS-25.00-8-10-10/B